# Altium schematic sheet Sheet2.SchDoc
size A4; SheetNumber: 1; SheetTotal: 1
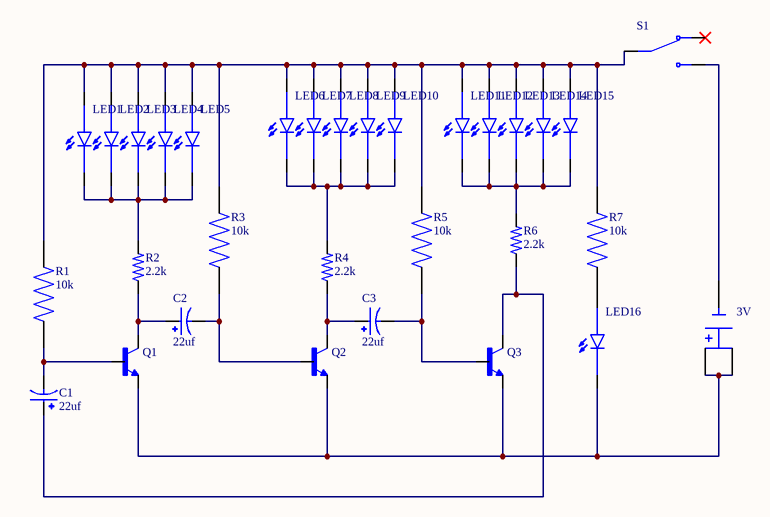
[diagram p0: Sheet2.SchDoc]

## Parts
3V  (no value)  [BAT_BK-921]
C1  22uf  [CAPPRD500W50D500H1100]
C2  22uf  [CAPPRD500W50D500H1100]
C3  22uf  [CAPPRD500W50D500H1100]
LED1  (no value)  [LED_WP7113ID]
LED2  (no value)  [LED_WP7113ID]
LED3  (no value)  [LED_WP7113ID]
LED4  (no value)  [LED_WP7113ID]
LED5  (no value)  [LED_WP7113ID]
LED6  (no value)  [LED_WP7113ID]
LED7  (no value)  [LED_WP7113ID]
LED8  (no value)  [LED_WP7113ID]
LED9  (no value)  [LED_WP7113ID]
LED10  (no value)  [LED_WP7113ID]
LED11  (no value)  [LED_WP7113ID]
LED12  (no value)  [LED_WP7113ID]
LED13  (no value)  [LED_WP7113ID]
LED14  (no value)  [LED_WP7113ID]
LED15  (no value)  [LED_WP7113ID]
LED16  (no value)  [LED_WP7113ID]
Q1  (no value)  [TO92254P470H750-3]
Q2  (no value)  [TO92254P470H750-3]
Q3  (no value)  [TO92254P470H750-3]
R1  10k  [RESC2012X65N]
R2  2.2k  [RESAD640W45L370D200]
R3  10k  [RESC2012X65N]
R4  2.2k  [RESAD640W45L370D200]
R5  10k  [RESC2012X65N]
R6  2.2k  [RESAD640W45L370D200]
R7  10k  [RESC2012X65N]
S1  (no value)  [SW_EG1270]

## Nets
Net3V_N: 3V.N S1.3
Net3V_P1: 3V.P1 3V.P2 LED16.C Q1.1(E) Q2.1(E) Q3.1(E)
NetC1_N: C1.N Q1.2(B) R1.1
NetC1_P: C1.P Q3.3(C) R6.1
NetC2_N: C2.N Q2.2(B) R3.1
NetC2_P: C2.P Q1.3(C) R2.1
NetC3_N: C3.N Q3.2(B) R5.1
NetC3_P: C3.P Q2.3(C) R4.1
NetLED1_A: LED1.A LED2.A LED3.A LED4.A LED5.A LED6.A LED7.A LED8.A LED9.A LED10.A LED11.A LED12.A LED13.A LED14.A LED15.A R1.2 R3.2 R5.2 R7.2 S1.2
NetLED1_C: LED1.C LED2.C LED3.C LED4.C LED5.C R2.2
NetLED6_C: LED6.C LED7.C LED8.C LED9.C LED10.C R4.2
NetLED11_C: LED11.C LED12.C LED13.C LED14.C LED15.C R6.2
NetLED16_A: LED16.A R7.1

Not connected (* = marked no-connect by the designer): S1 1*

## Library data of the parts
3V = BK-921: Package: None; Price: None; Value: *; MP: BK-921; Availability: Unavailable
C1-C3 = ECA1JHG220B: CAP ALUM 22UF 20% 63V RADIAL; MF: Panasonic; MP: ECA-1JHG220B; SnapEDA_Link: https://www.snapeda.com/parts/ECA-1JHG220B/Panasonic/view-part/?ref=snap; Package: RADIAL-2 Panasonic; Value: *; Check_prices: https://www.snapeda.com/parts/ECA-1JHG220B/Panasonic/view-part/?ref=eda
LED1-LED16 = WP7113ID: Red 617nm LED Indication - Discrete 2V Radial; MF: Kingbright; Price: None; MP: WP7113ID; Package: Radial Kingbright; Check_prices: https://www.snapeda.com/parts/WP7113ID/Kingbright/view-part/?ref=eda; Purchase-URL: https://pricing.snapeda.com/search/part/WP7113ID/?ref=eda; Availability: In Stock; Value: *; SnapEDA_Link: https://www.snapeda.com/parts/WP7113ID/Kingbright/view-part/?ref=snap
Q1-Q3 = 2N2222A: BJT, TO-92, 40V, 600mA, NPN, 0.625W, 150Â°C; MF: Diotec Semiconductor; SnapEDA_Link: https://www.snapeda.com/parts/2N2222A/Diotec/view-part/?ref=snap; Package: TO-92 Diotec; Value: *; MP: 2N2222A; Check_prices: https://www.snapeda.com/parts/2N2222A/Diotec/view-part/?ref=eda
R1 R3 R5 R7 = CRGH0805J10K: Resistor, Thick Film, Surface Mnt, 0805 10kOhm +/-5% 0.33W +/-200ppm/degC | TE Connectivity CRGH0805J10K; Power_Rating: .33 W; Voltage_Rating: 150 V; Tolerance: 5%; SnapEDA_Link: https://www.snapeda.com/parts/CRGH0805J10K/TE+Connectivity+Passive+Product/view-part/?ref=snap; Package: 0805; Resistance: 10K; Value: *; MF: TE Connectivity; MP: CRGH0805J10K; EU_RoHS_Compliance: Compliant with Exemptions; Check_prices: https://www.snapeda.com/parts/CRGH0805J10K/TE+Connectivity+Passive+Product/view-part/?ref=eda
R2 R4 R6 = LR0204F2K2: 2.2 kOhms Â±1% 0.25W, 1/4W Through Hole Resistor Axial - Metal Film; MF: TE Connectivity Passive Product; SnapEDA_Link: https://www.snapeda.com/parts/LR0204F2K2/TE/view-part/?ref=snap; Package: Axial TE Connectivity Passive Product; Value: *; MP: LR0204F2K2; Check_prices: https://www.snapeda.com/parts/LR0204F2K2/TE/view-part/?ref=eda
S1 = EG1270: Slide Switch, EG Series, SPDT, Non-Shorting, ON-ON, 300mA DC, 6VDC, R/A, PC | E-Switch EG1270; SnapEDA_Link: https://www.snapeda.com/parts/EG1270/E-Switch/view-part/?ref=snap; Package: None; Value: *; MF: E-Switch; MP: EG1270; Check_prices: https://www.snapeda.com/parts/EG1270/E-Switch/view-part/?ref=eda